# Altium project S56_MLD_tiny.PrjPcb
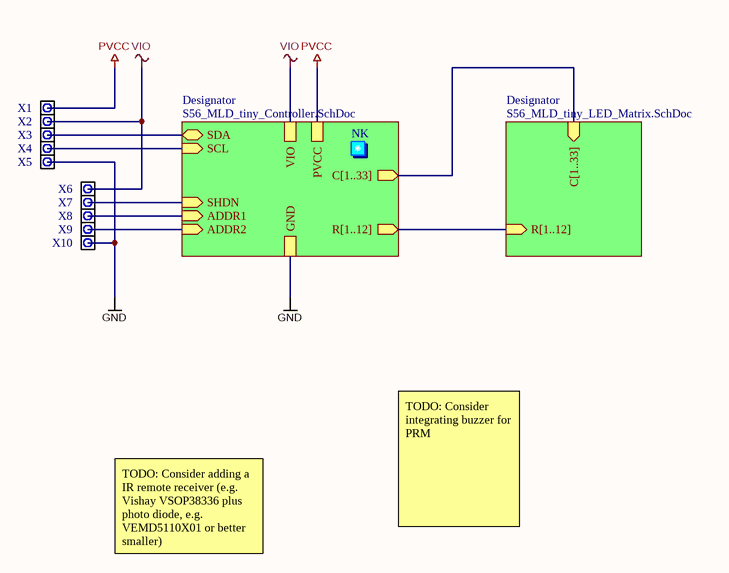
[diagram p0: S56_MLD_tiny_Main.SchDoc]
3 sheets, 185 parts. Net scope: hierarchical (ports join the sheet entries above them; power ports are global).
Board file: S56_MLD_tiny.pcbdoc
Sheets:
  S56_MLD_tiny_Main.SchDoc
    Designator = S56_MLD_tiny_LED_Matrix.SchDoc
    Designator = S56_MLD_tiny_Controller.SchDoc

## Sheet S56_MLD_tiny_Main.SchDoc
size A4; SheetNumber: 1; SheetTotal: 3

### Parts
NK  (no value)  [LOGO_NK_0MM5]  (no BOM)
X1  TEST_PIN  [TEST_PAD_S]  (value not drawn)
X2  TEST_PIN  [TEST_PAD_S]  (value not drawn)
X3  TEST_PIN  [TEST_PAD_S]  (value not drawn)
X4  TEST_PIN  [TEST_PAD_S]  (value not drawn)
X5  TEST_PIN  [TEST_PAD_S]  (value not drawn)
X6  TEST_PIN  [TEST_PAD_S]  (value not drawn)
X7  TEST_PIN  [TEST_PAD_S]  (value not drawn)
X8  TEST_PIN  [TEST_PAD_S]  (value not drawn)
X9  TEST_PIN  [TEST_PAD_S]  (value not drawn)
X10  TEST_PIN  [TEST_PAD_S]  (value not drawn)

### Sub-sheets
Designator = S56_MLD_tiny_LED_Matrix.SchDoc: R[1..12] (in), C[1..33] (in)
Designator = S56_MLD_tiny_Controller.SchDoc: GND, VIO, R[1..12] (out), C[1..33] (out), SCL (in), ADDR1 (in), SHDN (in), ADDR2 (in), PVCC, SDA (bidir)

### Nets
GND: X5.1 X10.1 ; sheet Designator/GND
PVCC: X1.1 ; sheet Designator/PVCC  [project net AVCC]
VIO: X2.1 X6.1 ; sheet Designator/VIO
ADDR1: X8.1 ; sheet Designator/ADDR1
ADDR2: X9.1 ; sheet Designator/ADDR2
SCL: X4.1 ; sheet Designator/SCL
SDA: X3.1 ; sheet Designator/SDA
SHDN: X7.1 ; sheet Designator/SHDN

### Notes on the sheet
- TODO: Consider adding a IR remote receiver (e.g. Vishay VSOP38336 plus photo diode, e.g. VEMD5110X01 or better smaller)
- TODO: Consider integrating buzzer for PRM

### Library data of the parts
NK = GENERIC_SYMBOL

## Sheet S56_MLD_tiny_LED_Matrix.SchDoc
size A4; SheetNumber: 2; SheetTotal: 3
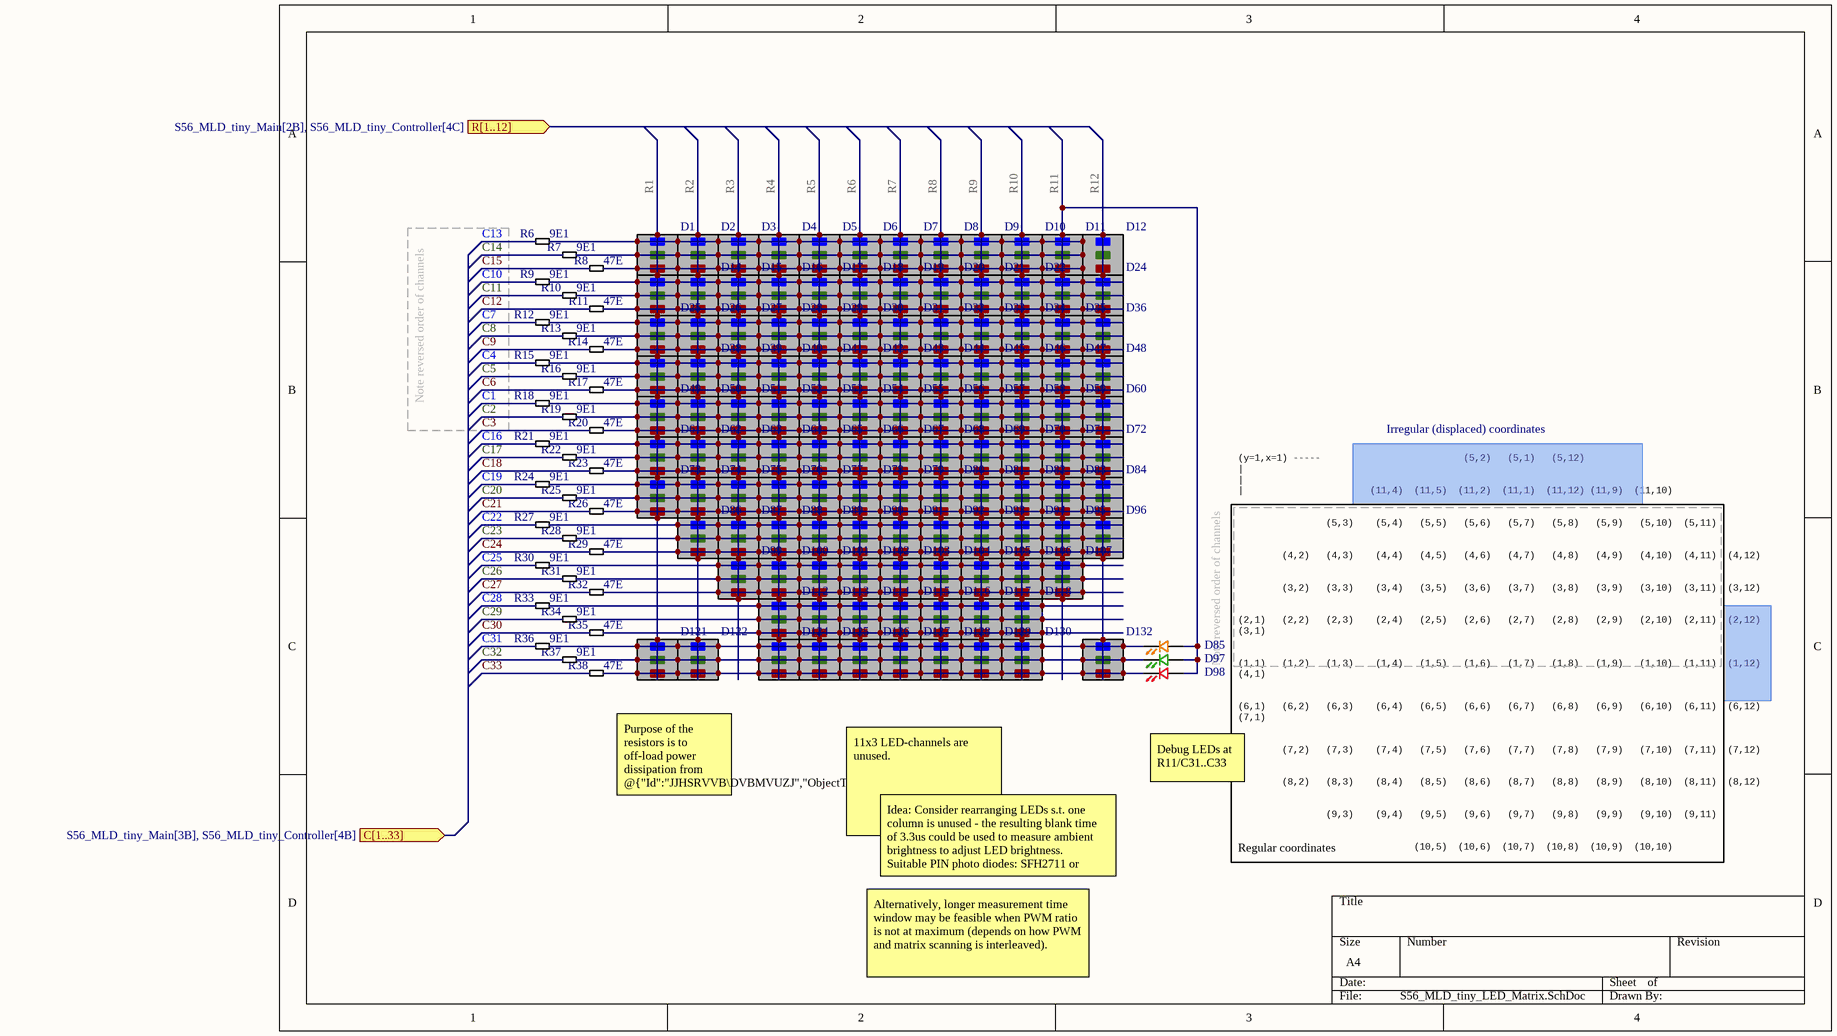
[diagram p1: S56_MLD_tiny_LED_Matrix.SchDoc]

### Parts
D1  LED_RGB_BLOCK  [PLCC-4_2020]  (value not drawn)
D2  LED_RGB_BLOCK  [PLCC-4_2020]  (value not drawn)
D3  LED_RGB_BLOCK  [PLCC-4_2020]  (value not drawn)
D4  LED_RGB_BLOCK  [PLCC-4_2020]  (value not drawn)
D5  LED_RGB_BLOCK  [PLCC-4_2020]  (value not drawn)
D6  LED_RGB_BLOCK  [PLCC-4_2020]  (value not drawn)
D7  LED_RGB_BLOCK  [PLCC-4_2020]  (value not drawn)
D8  LED_RGB_BLOCK  [PLCC-4_2020]  (value not drawn)
D9  LED_RGB_BLOCK  [PLCC-4_2020]  (value not drawn)
D10  LED_RGB_BLOCK  [PLCC-4_2020]  (value not drawn)
D11  LED_RGB_BLOCK  [PLCC-4_2020]  (value not drawn)
D12  LED_RGB_BLOCK  [PLCC-4_2020]  (value not drawn)
D13  LED_RGB_BLOCK  [PLCC-4_2020]  (value not drawn)
D14  LED_RGB_BLOCK  [PLCC-4_2020]  (value not drawn)
D15  LED_RGB_BLOCK  [PLCC-4_2020]  (value not drawn)
D16  LED_RGB_BLOCK  [PLCC-4_2020]  (value not drawn)
D17  LED_RGB_BLOCK  [PLCC-4_2020]  (value not drawn)
D18  LED_RGB_BLOCK  [PLCC-4_2020]  (value not drawn)
D19  LED_RGB_BLOCK  [PLCC-4_2020]  (value not drawn)
D20  LED_RGB_BLOCK  [PLCC-4_2020]  (value not drawn)
D21  LED_RGB_BLOCK  [PLCC-4_2020]  (value not drawn)
D22  LED_RGB_BLOCK  [PLCC-4_2020]  (value not drawn)
D23  LED_RGB_BLOCK  [PLCC-4_2020]  (value not drawn)
D24  LED_RGB_BLOCK  [PLCC-4_2020]  (value not drawn)
D25  LED_RGB_BLOCK  [PLCC-4_2020]  (value not drawn)
D26  LED_RGB_BLOCK  [PLCC-4_2020]  (value not drawn)
D27  LED_RGB_BLOCK  [PLCC-4_2020]  (value not drawn)
D28  LED_RGB_BLOCK  [PLCC-4_2020]  (value not drawn)
D29  LED_RGB_BLOCK  [PLCC-4_2020]  (value not drawn)
D30  LED_RGB_BLOCK  [PLCC-4_2020]  (value not drawn)
D31  LED_RGB_BLOCK  [PLCC-4_2020]  (value not drawn)
D32  LED_RGB_BLOCK  [PLCC-4_2020]  (value not drawn)
D33  LED_RGB_BLOCK  [PLCC-4_2020]  (value not drawn)
D34  LED_RGB_BLOCK  [PLCC-4_2020]  (value not drawn)
D35  LED_RGB_BLOCK  [PLCC-4_2020]  (value not drawn)
D36  LED_RGB_BLOCK  [PLCC-4_2020]  (value not drawn)
D37  LED_RGB_BLOCK  [PLCC-4_2020]  (value not drawn)
D38  LED_RGB_BLOCK  [PLCC-4_2020]  (value not drawn)
D39  LED_RGB_BLOCK  [PLCC-4_2020]  (value not drawn)
D40  LED_RGB_BLOCK  [PLCC-4_2020]  (value not drawn)
D41  LED_RGB_BLOCK  [PLCC-4_2020]  (value not drawn)
D42  LED_RGB_BLOCK  [PLCC-4_2020]  (value not drawn)
D43  LED_RGB_BLOCK  [PLCC-4_2020]  (value not drawn)
D44  LED_RGB_BLOCK  [PLCC-4_2020]  (value not drawn)
D45  LED_RGB_BLOCK  [PLCC-4_2020]  (value not drawn)
D46  LED_RGB_BLOCK  [PLCC-4_2020]  (value not drawn)
D47  LED_RGB_BLOCK  [PLCC-4_2020]  (value not drawn)
D48  LED_RGB_BLOCK  [PLCC-4_2020]  (value not drawn)
D49  LED_RGB_BLOCK  [PLCC-4_2020]  (value not drawn)
D50  LED_RGB_BLOCK  [PLCC-4_2020]  (value not drawn)
D51  LED_RGB_BLOCK  [PLCC-4_2020]  (value not drawn)
D52  LED_RGB_BLOCK  [PLCC-4_2020]  (value not drawn)
D53  LED_RGB_BLOCK  [PLCC-4_2020]  (value not drawn)
D54  LED_RGB_BLOCK  [PLCC-4_2020]  (value not drawn)
D55  LED_RGB_BLOCK  [PLCC-4_2020]  (value not drawn)
D56  LED_RGB_BLOCK  [PLCC-4_2020]  (value not drawn)
D57  LED_RGB_BLOCK  [PLCC-4_2020]  (value not drawn)
D58  LED_RGB_BLOCK  [PLCC-4_2020]  (value not drawn)
D59  LED_RGB_BLOCK  [PLCC-4_2020]  (value not drawn)
D60  LED_RGB_BLOCK  [PLCC-4_2020]  (value not drawn)
D61  LED_RGB_BLOCK  [PLCC-4_2020]  (value not drawn)
D62  LED_RGB_BLOCK  [PLCC-4_2020]  (value not drawn)
D63  LED_RGB_BLOCK  [PLCC-4_2020]  (value not drawn)
D64  LED_RGB_BLOCK  [PLCC-4_2020]  (value not drawn)
D65  LED_RGB_BLOCK  [PLCC-4_2020]  (value not drawn)
D66  LED_RGB_BLOCK  [PLCC-4_2020]  (value not drawn)
D67  LED_RGB_BLOCK  [PLCC-4_2020]  (value not drawn)
D68  LED_RGB_BLOCK  [PLCC-4_2020]  (value not drawn)
D69  LED_RGB_BLOCK  [PLCC-4_2020]  (value not drawn)
D70  LED_RGB_BLOCK  [PLCC-4_2020]  (value not drawn)
D71  LED_RGB_BLOCK  [PLCC-4_2020]  (value not drawn)
D72  LED_RGB_BLOCK  [PLCC-4_2020]  (value not drawn)
D73  LED_RGB_BLOCK  [PLCC-4_2020]  (value not drawn)
D74  LED_RGB_BLOCK  [PLCC-4_2020]  (value not drawn)
D75  LED_RGB_BLOCK  [PLCC-4_2020]  (value not drawn)
D76  LED_RGB_BLOCK  [PLCC-4_2020]  (value not drawn)
D77  LED_RGB_BLOCK  [PLCC-4_2020]  (value not drawn)
D78  LED_RGB_BLOCK  [PLCC-4_2020]  (value not drawn)
D79  LED_RGB_BLOCK  [PLCC-4_2020]  (value not drawn)
D80  LED_RGB_BLOCK  [PLCC-4_2020]  (value not drawn)
D81  LED_RGB_BLOCK  [PLCC-4_2020]  (value not drawn)
D82  LED_RGB_BLOCK  [PLCC-4_2020]  (value not drawn)
D83  LED_RGB_BLOCK  [PLCC-4_2020]  (value not drawn)
D84  LED_RGB_BLOCK  [PLCC-4_2020]  (value not drawn)
D85  LED_ORANGE  [D0402G]  (value not drawn)
D86  LED_RGB_BLOCK  [PLCC-4_2020]  (value not drawn)
D87  LED_RGB_BLOCK  [PLCC-4_2020]  (value not drawn)
D88  LED_RGB_BLOCK  [PLCC-4_2020]  (value not drawn)
D89  LED_RGB_BLOCK  [PLCC-4_2020]  (value not drawn)
D90  LED_RGB_BLOCK  [PLCC-4_2020]  (value not drawn)
D91  LED_RGB_BLOCK  [PLCC-4_2020]  (value not drawn)
D92  LED_RGB_BLOCK  [PLCC-4_2020]  (value not drawn)
D93  LED_RGB_BLOCK  [PLCC-4_2020]  (value not drawn)
D94  LED_RGB_BLOCK  [PLCC-4_2020]  (value not drawn)
D95  LED_RGB_BLOCK  [PLCC-4_2020]  (value not drawn)
D96  LED_RGB_BLOCK  [PLCC-4_2020]  (value not drawn)
D97  LED_GREEN  [D0402G]  (value not drawn)
D98  LED_RED  [D0402G]  (value not drawn)
D99  LED_RGB_BLOCK  [PLCC-4_2020]  (value not drawn)
D100  LED_RGB_BLOCK  [PLCC-4_2020]  (value not drawn)
D101  LED_RGB_BLOCK  [PLCC-4_2020]  (value not drawn)
D102  LED_RGB_BLOCK  [PLCC-4_2020]  (value not drawn)
D103  LED_RGB_BLOCK  [PLCC-4_2020]  (value not drawn)
D104  LED_RGB_BLOCK  [PLCC-4_2020]  (value not drawn)
D105  LED_RGB_BLOCK  [PLCC-4_2020]  (value not drawn)
D106  LED_RGB_BLOCK  [PLCC-4_2020]  (value not drawn)
D107  LED_RGB_BLOCK  [PLCC-4_2020]  (value not drawn)
D112  LED_RGB_BLOCK  [PLCC-4_2020]  (value not drawn)
D113  LED_RGB_BLOCK  [PLCC-4_2020]  (value not drawn)
D114  LED_RGB_BLOCK  [PLCC-4_2020]  (value not drawn)
D115  LED_RGB_BLOCK  [PLCC-4_2020]  (value not drawn)
D116  LED_RGB_BLOCK  [PLCC-4_2020]  (value not drawn)
D117  LED_RGB_BLOCK  [PLCC-4_2020]  (value not drawn)
D118  LED_RGB_BLOCK  [PLCC-4_2020]  (value not drawn)
D121  LED_RGB_BLOCK  [PLCC-4_2020]  (value not drawn)
D122  LED_RGB_BLOCK  [PLCC-4_2020]  (value not drawn)
D124  LED_RGB_BLOCK  [PLCC-4_2020]  (value not drawn)
D125  LED_RGB_BLOCK  [PLCC-4_2020]  (value not drawn)
D126  LED_RGB_BLOCK  [PLCC-4_2020]  (value not drawn)
D127  LED_RGB_BLOCK  [PLCC-4_2020]  (value not drawn)
D128  LED_RGB_BLOCK  [PLCC-4_2020]  (value not drawn)
D129  LED_RGB_BLOCK  [PLCC-4_2020]  (value not drawn)
D130  LED_RGB_BLOCK  [PLCC-4_2020]  (value not drawn)
D132  LED_RGB_BLOCK  [PLCC-4_2020]  (value not drawn)
R6  9E1  [R0402G]
R7  9E1  [R0402G]
R8  47E  [R0402G]
R9  9E1  [R0402G]
R10  9E1  [R0402G]
R11  47E  [R0402G]
R12  9E1  [R0402G]
R13  9E1  [R0402G]
R14  47E  [R0402G]
R15  9E1  [R0402G]
R16  9E1  [R0402G]
R17  47E  [R0402G]
R18  9E1  [R0402G]
R19  9E1  [R0402G]
R20  47E  [R0402G]
R21  9E1  [R0402G]
R22  9E1  [R0402G]
R23  47E  [R0402G]
R24  9E1  [R0402G]
R25  9E1  [R0402G]
R26  47E  [R0402G]
R27  9E1  [R0402G]
R28  9E1  [R0402G]
R29  47E  [R0402G]
R30  9E1  [R0402G]
R31  9E1  [R0402G]
R32  47E  [R0402G]
R33  9E1  [R0402G]
R34  9E1  [R0402G]
R35  47E  [R0402G]
R36  9E1  [R0402G]
R37  9E1  [R0402G]
R38  47E  [R0402G]

### Ports
C[1..33] (in, see S56_MLD_tiny_Main[3B], S56_MLD_tiny_Controller[4B]), R[1..12] (in, see S56_MLD_tiny_Main[2B], S56_MLD_tiny_Controller[4C])

### Nets
C1: R18.2
C2: R19.2
C3: R20.2
C4: R15.2
C5: R16.2
C6: R17.2
C7: R12.2
C8: R13.2
C9: R14.2
C10: R9.2
C11: R10.2
C12: R11.2
C13: R6.2
C14: R7.2
C15: R8.2
C16: R21.2
C17: R22.2
C18: R23.2
C19: R24.2
C20: R25.2
C21: R26.2
C22: R27.2
C23: R28.2
C24: R29.2
C25: R30.2
C26: R31.2
C27: R32.2
C28: R33.2
C29: R34.2
C30: R35.2
C31: R36.2
C32: R37.2
C33: R38.2
R1: D1.1(CA) D13.1(CA) D25.1(CA) D37.1(CA) D49.1(CA) D61.1(CA) D73.1(CA) D121.1(CA)
R2: D2.1(CA) D14.1(CA) D26.1(CA) D38.1(CA) D50.1(CA) D62.1(CA) D74.1(CA) D86.1(CA) D122.1(CA)
R3: D3.1(CA) D15.1(CA) D27.1(CA) D39.1(CA) D51.1(CA) D63.1(CA) D75.1(CA) D87.1(CA) D99.1(CA)
R4: D4.1(CA) D16.1(CA) D28.1(CA) D40.1(CA) D52.1(CA) D64.1(CA) D76.1(CA) D88.1(CA) D100.1(CA) D112.1(CA) D124.1(CA)
R5: D5.1(CA) D17.1(CA) D29.1(CA) D41.1(CA) D53.1(CA) D65.1(CA) D77.1(CA) D89.1(CA) D101.1(CA) D113.1(CA) D125.1(CA)
R6: D6.1(CA) D18.1(CA) D30.1(CA) D42.1(CA) D54.1(CA) D66.1(CA) D78.1(CA) D90.1(CA) D102.1(CA) D114.1(CA) D126.1(CA)
R7: D7.1(CA) D19.1(CA) D31.1(CA) D43.1(CA) D55.1(CA) D67.1(CA) D79.1(CA) D91.1(CA) D103.1(CA) D115.1(CA) D127.1(CA)
R8: D8.1(CA) D20.1(CA) D32.1(CA) D44.1(CA) D56.1(CA) D68.1(CA) D80.1(CA) D92.1(CA) D104.1(CA) D116.1(CA) D128.1(CA)
R9: D9.1(CA) D21.1(CA) D33.1(CA) D45.1(CA) D57.1(CA) D69.1(CA) D81.1(CA) D93.1(CA) D105.1(CA) D117.1(CA) D129.1(CA)
R10: D10.1(CA) D22.1(CA) D34.1(CA) D46.1(CA) D58.1(CA) D70.1(CA) D82.1(CA) D94.1(CA) D106.1(CA) D118.1(CA) D130.1(CA)
R11: D11.1(CA) D23.1(CA) D35.1(CA) D47.1(CA) D59.1(CA) D71.1(CA) D83.1(CA) D85.A D95.1(CA) D97.A D98.A D107.1(CA)
R12: D12.1(CA) D24.1(CA) D36.1(CA) D48.1(CA) D60.1(CA) D72.1(CA) D84.1(CA) D96.1(CA) D132.1(CA)
NetD1_2: D1.2(B) D2.2(B) D3.2(B) D4.2(B) D5.2(B) D6.2(B) D7.2(B) D8.2(B) D9.2(B) D10.2(B) D11.2(B) D12.2(B) R6.1
NetD1_3: D1.3(G) D2.3(G) D3.3(G) D4.3(G) D5.3(G) D6.3(G) D7.3(G) D8.3(G) D9.3(G) D10.3(G) D11.3(G) D12.3(G) R7.1
NetD1_4: D1.4(R) D2.4(R) D3.4(R) D4.4(R) D5.4(R) D6.4(R) D7.4(R) D8.4(R) D9.4(R) D10.4(R) D11.4(R) D12.4(R) R8.1
NetD13_2: D13.2(B) D14.2(B) D15.2(B) D16.2(B) D17.2(B) D18.2(B) D19.2(B) D20.2(B) D21.2(B) D22.2(B) D23.2(B) D24.2(B) R9.1
NetD13_3: D13.3(G) D14.3(G) D15.3(G) D16.3(G) D17.3(G) D18.3(G) D19.3(G) D20.3(G) D21.3(G) D22.3(G) D23.3(G) D24.3(G) R10.1
NetD13_4: D13.4(R) D14.4(R) D15.4(R) D16.4(R) D17.4(R) D18.4(R) D19.4(R) D20.4(R) D21.4(R) D22.4(R) D23.4(R) D24.4(R) R11.1
NetD25_2: D25.2(B) D26.2(B) D27.2(B) D28.2(B) D29.2(B) D30.2(B) D31.2(B) D32.2(B) D33.2(B) D34.2(B) D35.2(B) D36.2(B) R12.1
NetD25_3: D25.3(G) D26.3(G) D27.3(G) D28.3(G) D29.3(G) D30.3(G) D31.3(G) D32.3(G) D33.3(G) D34.3(G) D35.3(G) D36.3(G) R13.1
NetD25_4: D25.4(R) D26.4(R) D27.4(R) D28.4(R) D29.4(R) D30.4(R) D31.4(R) D32.4(R) D33.4(R) D34.4(R) D35.4(R) D36.4(R) R14.1
NetD37_2: D37.2(B) D38.2(B) D39.2(B) D40.2(B) D41.2(B) D42.2(B) D43.2(B) D44.2(B) D45.2(B) D46.2(B) D47.2(B) D48.2(B) R15.1
NetD37_3: D37.3(G) D38.3(G) D39.3(G) D40.3(G) D41.3(G) D42.3(G) D43.3(G) D44.3(G) D45.3(G) D46.3(G) D47.3(G) D48.3(G) R16.1
NetD37_4: D37.4(R) D38.4(R) D39.4(R) D40.4(R) D41.4(R) D42.4(R) D43.4(R) D44.4(R) D45.4(R) D46.4(R) D47.4(R) D48.4(R) R17.1
NetD49_2: D49.2(B) D50.2(B) D51.2(B) D52.2(B) D53.2(B) D54.2(B) D55.2(B) D56.2(B) D57.2(B) D58.2(B) D59.2(B) D60.2(B) R18.1
NetD49_3: D49.3(G) D50.3(G) D51.3(G) D52.3(G) D53.3(G) D54.3(G) D55.3(G) D56.3(G) D57.3(G) D58.3(G) D59.3(G) D60.3(G) R19.1
NetD49_4: D49.4(R) D50.4(R) D51.4(R) D52.4(R) D53.4(R) D54.4(R) D55.4(R) D56.4(R) D57.4(R) D58.4(R) D59.4(R) D60.4(R) R20.1
NetD61_2: D61.2(B) D62.2(B) D63.2(B) D64.2(B) D65.2(B) D66.2(B) D67.2(B) D68.2(B) D69.2(B) D70.2(B) D71.2(B) D72.2(B) R21.1
NetD61_3: D61.3(G) D62.3(G) D63.3(G) D64.3(G) D65.3(G) D66.3(G) D67.3(G) D68.3(G) D69.3(G) D70.3(G) D71.3(G) D72.3(G) R22.1
NetD61_4: D61.4(R) D62.4(R) D63.4(R) D64.4(R) D65.4(R) D66.4(R) D67.4(R) D68.4(R) D69.4(R) D70.4(R) D71.4(R) D72.4(R) R23.1
NetD73_2: D73.2(B) D74.2(B) D75.2(B) D76.2(B) D77.2(B) D78.2(B) D79.2(B) D80.2(B) D81.2(B) D82.2(B) D83.2(B) D84.2(B) R24.1
NetD73_3: D73.3(G) D74.3(G) D75.3(G) D76.3(G) D77.3(G) D78.3(G) D79.3(G) D80.3(G) D81.3(G) D82.3(G) D83.3(G) D84.3(G) R25.1
NetD73_4: D73.4(R) D74.4(R) D75.4(R) D76.4(R) D77.4(R) D78.4(R) D79.4(R) D80.4(R) D81.4(R) D82.4(R) D83.4(R) D84.4(R) R26.1
NetD85_K: D85.K D121.2(B) D122.2(B) D124.2(B) D125.2(B) D126.2(B) D127.2(B) D128.2(B) D129.2(B) D130.2(B) D132.2(B) R36.1
NetD86_2: D86.2(B) D87.2(B) D88.2(B) D89.2(B) D90.2(B) D91.2(B) D92.2(B) D93.2(B) D94.2(B) D95.2(B) D96.2(B) R27.1
NetD86_3: D86.3(G) D87.3(G) D88.3(G) D89.3(G) D90.3(G) D91.3(G) D92.3(G) D93.3(G) D94.3(G) D95.3(G) D96.3(G) R28.1
NetD86_4: D86.4(R) D87.4(R) D88.4(R) D89.4(R) D90.4(R) D91.4(R) D92.4(R) D93.4(R) D94.4(R) D95.4(R) D96.4(R) R29.1
NetD97_K: D97.K D121.3(G) D122.3(G) D124.3(G) D125.3(G) D126.3(G) D127.3(G) D128.3(G) D129.3(G) D130.3(G) D132.3(G) R37.1
NetD98_K: D98.K D121.4(R) D122.4(R) D124.4(R) D125.4(R) D126.4(R) D127.4(R) D128.4(R) D129.4(R) D130.4(R) D132.4(R) R38.1
NetD99_2: D99.2(B) D100.2(B) D101.2(B) D102.2(B) D103.2(B) D104.2(B) D105.2(B) D106.2(B) D107.2(B) R30.1
NetD99_3: D99.3(G) D100.3(G) D101.3(G) D102.3(G) D103.3(G) D104.3(G) D105.3(G) D106.3(G) D107.3(G) R31.1
NetD99_4: D99.4(R) D100.4(R) D101.4(R) D102.4(R) D103.4(R) D104.4(R) D105.4(R) D106.4(R) D107.4(R) R32.1
NetD112_2: D112.2(B) D113.2(B) D114.2(B) D115.2(B) D116.2(B) D117.2(B) D118.2(B) R33.1
NetD112_3: D112.3(G) D113.3(G) D114.3(G) D115.3(G) D116.3(G) D117.3(G) D118.3(G) R34.1
NetD112_4: D112.4(R) D113.4(R) D114.4(R) D115.4(R) D116.4(R) D117.4(R) D118.4(R) R35.1

### Notes on the sheet
- Note reversed order of channels
- Irregular (displaced) coordinates
- Purpose of the resistors is to off-load power dissipation from @{"Id":"JJHSRVVB\DVBMVUZJ","ObjectType":2}.
- Debug LEDs at R11/C31..C33
- 11x3 LED-channels are unused.
- Regular coordinates
- Idea: Consider rearranging LEDs s.t. one column is unused - the resulting blank time of 3.3us could be used to measure ambient brightness to adjust LED brightness.
  Suitable PIN photo diodes: SFH2711 or 7SFH2713.
- (y=1,x=1) -----                          (5,2)   (5,1)   (5,12)
  |
  |
  |                       (11,4)  (11,5)  (11,2)  (11,1)  (11,12) (11,9)  (11,10)
  (5,3)    (5,4)   (5,5)   (5,6)   (5,7)   (5,8)   (5,9)   (5,10)  (5,11)
  (4,2)   (4,3)    (4,4)   (4,5)   (4,6)   (4,7)   (4,8)   (4,9)   (4,10)  (4,11)  (4,12)
  (3,2)   (3,3)    (3,4)   (3,5)   (3,6)   (3,7)   (3,8)   (3,9)   (3,10)  (3,11)  (3,12)
  (2,1)   (2,2)   (2,3)    (2,4)   (2,5)   (2,6)   (2,7)   (2,8)   (2,9)   (2,10)  (2,11)  (2,12)  (3,1)
  (1,1)   (1,2)   (1,3)    (1,4)   (1,5)   (1,6)   (1,7)   (1,8)   (1,9)   (1,10)  (1,11)  (1,12)  (4,1)
  (6,1)   (6,2)   (6,3)    (6,4)   (6,5)   (6,6)   (6,7)   (6,8)   (6,9)   (6,10)  (6,11)  (6,12)  (7,1)
  (7,2)   (7,3)    (7,4)   (7,5)   (7,6)   (7,7)   (7,8)   (7,9)   (7,10)  (7,11)  (7,12)
  (8,2)   (8,3)    (8,4)   (8,5)   (8,6)   (8,7)   (8,8)   (8,9)   (8,10)  (8,11)  (8,12)
  (9,3)    (9,4)   (9,5)   (9,6)   (9,7)   (9,8)   (9,9)   (9,10)  (9,11)
  (10,4)  (10,5)  (10,6)  (10,7)  (10,8)  (10,9)  (10,10)
  (11,6)  (11,7)  (11,8)
- Alternatively, longer measurement time window may be feasible when PWM ratio is not at maximum (depends on how PWM and matrix scanning is interleaved).

### Library data of the parts
D1-D84 D86-D96 D99-D107 D112-D118 D121 D122 D124-D130 D132 = LED_RGB_BLOCK: Part: CLMVC-FKA-CL1D1L71BB7C3C3; Manufacturer: Cree LED; Digikey: CLMVC-FKA-CL1D1L71BB7C3C3CT-ND
D85 = LED_ORANGE: LED
D97 = LED_GREEN: LED
D98 = LED_RED: LED
R6 R7 R9 R10 R12 R13 R15 R16 R18 R19 R21 R22 R24 R25 R27 R28 R30 R31 R33 R34 R36 R37 = RES10_: Resistor; Part: RC0402FR-079R1L; Manufacturer: YAGEO; Value: 9E1; Digikey: 13-RC0402FR-079R1LCT-ND
R8 R11 R14 R17 R20 R23 R26 R29 R32 R35 R38 = RES10_: Resistor; Part: RC0402FR-0747RL; Manufacturer: YAGEO; Value: 47E; Digikey: 311-47.0LRCT-ND

## Sheet S56_MLD_tiny_Controller.SchDoc
size A4; SheetNumber: 3; SheetTotal: 3
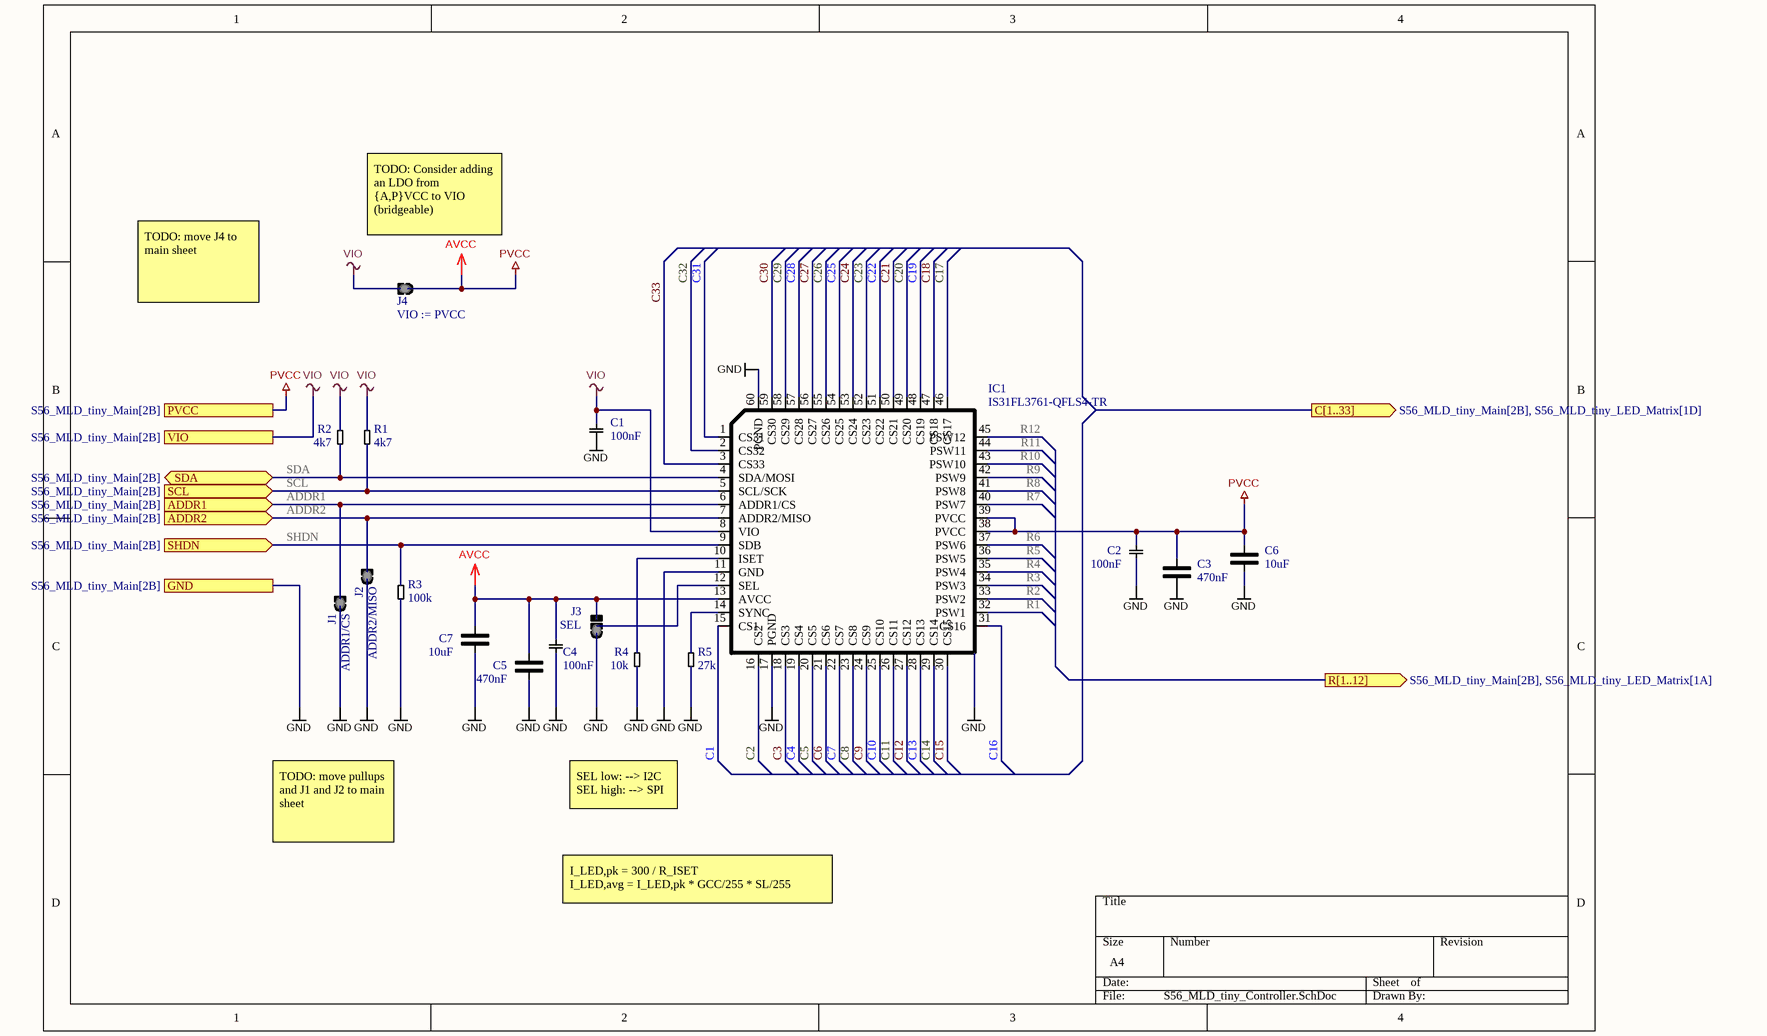
[diagram p2: S56_MLD_tiny_Controller.SchDoc]

### Parts
C1  100nF  [C0402G]
C2  100nF  [C0402G]
C3  470nF  [C0603G]
C4  100nF  [C0402G]
C5  470nF  [C0603G]
C6  10uF  [C0805G]
C7  10uF  [C0805G]
IC1  IS31FL3761-QFLS4-TR  [QFN40P700X700X80_HS-61N]
J1  ADDR1/CS  [R0402G]
J2  ADDR2/MISO  [R0402G]
J3  SEL  [JUMP_2W_0402]
J4  VIO := PVCC  [JUMP_1W_0603_SOLDER]
R1  4k7  [R0402G]
R2  4k7  [R0402G]
R3  100k  [R0402G]
R4  10k  [R0402G]
R5  27k  [R0402G]

### Ports
ADDR1 (in, see S56_MLD_tiny_Main[2B]), ADDR2 (in, see S56_MLD_tiny_Main[2B]), C[1..33] (out, see S56_MLD_tiny_Main[2B], S56_MLD_tiny_LED_Matrix[1D]), GND (see S56_MLD_tiny_Main[2B]), PVCC (see S56_MLD_tiny_Main[2B]), R[1..12] (out, see S56_MLD_tiny_Main[2B], S56_MLD_tiny_LED_Matrix[1A]), SCL (in, see S56_MLD_tiny_Main[2B]), SDA (bidir, see S56_MLD_tiny_Main[2B]), SHDN (in, see S56_MLD_tiny_Main[2B]), VIO (see S56_MLD_tiny_Main[2B])

### Nets
AVCC: C2.2 C3.2 C4.2 C5.2 C6.2 C7.2 IC1.13(AVCC) IC1.38(PVCC) IC1.39(PVCC) J3.3 J4.1 ; port PVCC  [also labelled PVCC]
GND: C1.2 C2.1 C3.1 C4.1 C5.1 C6.1 C7.1 IC1.11(GND) IC1.17(PGND) IC1.60(PGND) IC1.61(GND) J1.1 J2.1 J3.1 R3.1 R4.1 R5.1 ; port GND
VIO: C1.1 IC1.8(VIO) J4.2 R1.2 R2.2 ; port VIO
ADDR1: IC1.6(ADDR1/CS) J1.2 ; port ADDR1
ADDR2: IC1.7(ADDR2/MISO) J2.2 ; port ADDR2
C1: IC1.15(CS1)
C2: IC1.16(CS2)
C3: IC1.18(CS3)
C4: IC1.19(CS4)
C5: IC1.20(CS5)
C6: IC1.21(CS6)
C7: IC1.22(CS7)
C8: IC1.23(CS8)
C9: IC1.24(CS9)
C10: IC1.25(CS10)
C11: IC1.26(CS11)
C12: IC1.27(CS12)
C13: IC1.28(CS13)
C14: IC1.29(CS14)
C15: IC1.30(CS15)
C16: IC1.31(CS16)
C17: IC1.46(CS17)
C18: IC1.47(CS18)
C19: IC1.48(CS19)
C20: IC1.49(CS20)
C21: IC1.50(CS21)
C22: IC1.51(CS22)
C23: IC1.52(CS23)
C24: IC1.53(CS24)
C25: IC1.54(CS25)
C26: IC1.55(CS26)
C27: IC1.56(CS27)
C28: IC1.57(CS28)
C29: IC1.58(CS29)
C30: IC1.59(CS30)
C31: IC1.1(CS31)
C32: IC1.2(CS32)
C33: IC1.3(CS33)
R1: IC1.32(PSW1)
R2: IC1.33(PSW2)
R3: IC1.34(PSW3)
R4: IC1.35(PSW4)
R5: IC1.36(PSW5)
R6: IC1.37(PSW6)
R7: IC1.40(PSW7)
R8: IC1.41(PSW8)
R9: IC1.42(PSW9)
R10: IC1.43(PSW10)
R11: IC1.44(PSW11)
R12: IC1.45(PSW12)
SCL: IC1.5(SCL/SCK) R1.1 ; port SCL
SDA: IC1.4(SDA/MOSI) R2.1 ; port SDA
SHDN: IC1.9(SDB) R3.2 ; port SHDN
NetIC1_10: IC1.10(ISET) R4.2
NetIC1_12: IC1.12(SEL) J3.2
NetIC1_14: IC1.14(SYNC) R5.2

Not connected (* = marked no-connect by the designer): IC1 0(HEAT_SLUG)

### Notes on the sheet
- TODO: Consider adding an LDO from {A,P}VCC to VIO (bridgeable)
- TODO: move J4 to main sheet
- TODO: move pullups and J1 and J2 to main sheet
- SEL low: --> I2C
  SEL high: --> SPI
- I_LED,pk = 300 / R_ISET
  I_LED,avg = I_LED,pk * GCC/255 * SL/255

### Library data of the parts
C1 C2 C4 = CAP10: Capacitor, unipolar; Value: 100nF
C3 C5 = CAP20L: Capacitor, unipolar; Part: KAM15BR71E474KT; Manufacturer: KYOCERA AVX; Value: 470nF; Digikey: 478-KAM15BR71E474KTCT-ND
C6 C7 = CAP20L: Capacitor, unipolar; Part: CL21A106KOQNNNE; Manufacturer: Samsung Electro-Mechanics; Value: 10uF; Digikey: 1276-1096-1-ND
IC1 = IS31FL3761: IS31FL3761 in QFN-60; Manufacturer: Lumissil Microsystems; Part: IS31FL3761-QFLS4-TR; Digikey: 2521-IS31FL3761-QFLS4-TRCT-ND
J1 J2 J4 = JUMP_1WAY_SMD_HAT_SET
J3 = JUMP_2WAY_SMD_HAT_SET1
R1-R5 = RES10_: Resistor
  R1 R2: Value: 4k7
  R3: Value: 100k
  R4: Value: 10k
  R5: Value: 27k

## Nets that join several sheets
AVCC: S56_MLD_tiny_Main (X1.1), S56_MLD_tiny_Controller (11 pins)
GND: S56_MLD_tiny_Main (X5.1 X10.1), S56_MLD_tiny_Controller (17 pins)
VIO: S56_MLD_tiny_Main (X2.1 X6.1), S56_MLD_tiny_Controller (5 pins)
ADDR1: S56_MLD_tiny_Main (X8.1), S56_MLD_tiny_Controller (IC1.6 J1.2)
ADDR2: S56_MLD_tiny_Main (X9.1), S56_MLD_tiny_Controller (IC1.7 J2.2)
SCL: S56_MLD_tiny_Main (X4.1), S56_MLD_tiny_Controller (IC1.5 R1.1)
SDA: S56_MLD_tiny_Main (X3.1), S56_MLD_tiny_Controller (IC1.4 R2.1)
SHDN: S56_MLD_tiny_Main (X7.1), S56_MLD_tiny_Controller (IC1.9 R3.2)

## Assembly variants
Prototype: all parts fitted